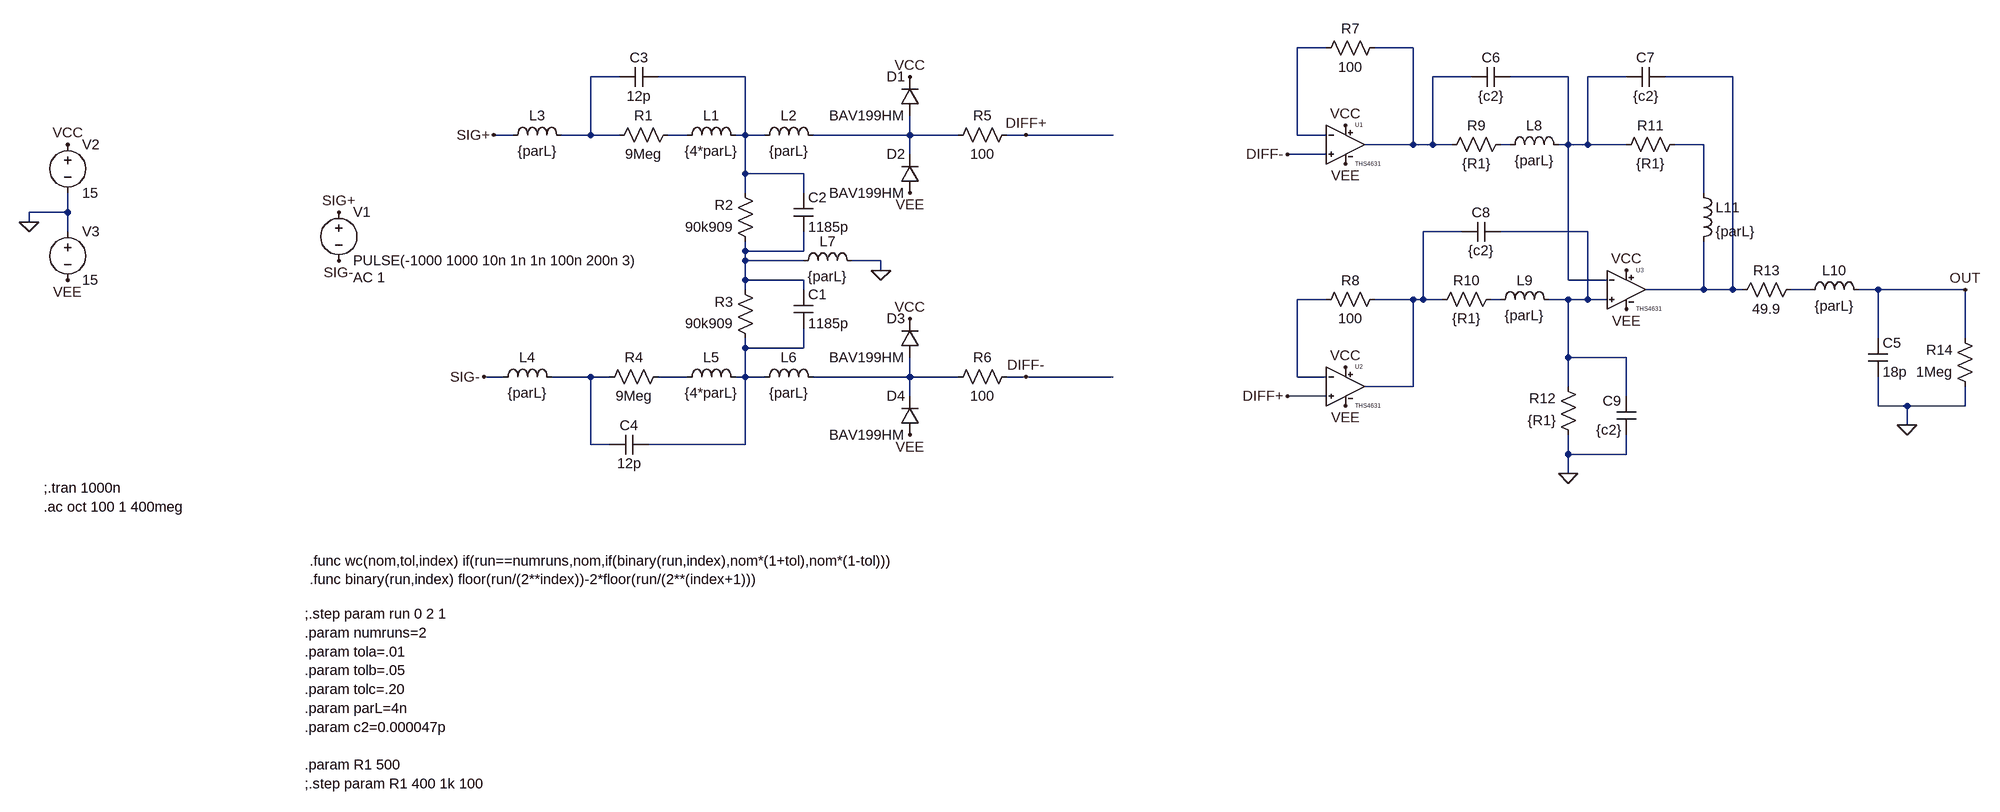
[diagram p0: schematic differential_probe_2.asc]
differential_probe_2.asc, the LTspice schematic file:
Version 4
SHEET 1 2412 1172
WIRE 1136 -32 1088 -32
WIRE 1280 -32 1216 -32
WIRE -32 16 -80 16
WIRE 176 16 32 16
WIRE 1376 16 1312 16
WIRE 1536 16 1440 16
WIRE 1632 16 1568 16
WIRE 1808 16 1696 16
WIRE -208 112 -240 112
WIRE -80 112 -80 16
WIRE -80 112 -128 112
WIRE -32 112 -80 112
WIRE 80 112 48 112
WIRE 176 112 176 16
WIRE 176 112 160 112
WIRE 208 112 176 112
WIRE 448 112 448 80
WIRE 448 112 288 112
WIRE 528 112 448 112
WIRE 640 112 608 112
WIRE 784 112 640 112
WIRE 1088 112 1088 -32
WIRE 1136 112 1088 112
WIRE 1280 128 1280 -32
WIRE 1280 128 1200 128
WIRE 1312 128 1312 16
WIRE 1312 128 1280 128
WIRE 1344 128 1312 128
WIRE 1440 128 1424 128
WIRE 1536 128 1536 16
WIRE 1536 128 1520 128
WIRE 1568 128 1568 16
WIRE 1568 128 1536 128
WIRE 1632 128 1568 128
WIRE 1760 128 1712 128
WIRE 448 144 448 112
WIRE 1136 144 1072 144
WIRE 176 176 176 112
WIRE 272 176 176 176
WIRE 176 208 176 176
WIRE 272 208 272 176
WIRE 1760 208 1760 128
WIRE -944 240 -944 208
WIRE -944 240 -1008 240
WIRE -1008 256 -1008 240
WIRE -944 272 -944 240
WIRE 1360 272 1296 272
WIRE 1568 272 1424 272
WIRE 176 304 176 288
WIRE 272 304 272 272
WIRE 272 304 176 304
WIRE 176 320 176 304
WIRE 272 320 176 320
WIRE 400 320 352 320
WIRE 400 336 400 320
WIRE 176 352 176 320
WIRE 272 352 176 352
WIRE 1536 352 1536 128
WIRE 1600 352 1536 352
WIRE 176 368 176 352
WIRE 272 368 272 352
WIRE 1760 368 1760 288
WIRE 1760 368 1664 368
WIRE 1808 368 1808 16
WIRE 1808 368 1760 368
WIRE 1824 368 1808 368
WIRE 1936 368 1904 368
WIRE 2048 368 2016 368
WIRE 2192 368 2048 368
WIRE 1136 384 1088 384
WIRE 1280 384 1216 384
WIRE 1296 384 1296 272
WIRE 1296 384 1280 384
WIRE 1328 384 1296 384
WIRE 1424 384 1408 384
WIRE 1536 384 1504 384
WIRE 1568 384 1568 272
WIRE 1568 384 1536 384
WIRE 1600 384 1568 384
WIRE 2048 448 2048 368
WIRE 2192 448 2192 368
WIRE 176 464 176 448
WIRE 272 464 272 432
WIRE 272 464 176 464
WIRE 1536 480 1536 384
WIRE 1632 480 1536 480
WIRE -224 512 -256 512
WIRE -80 512 -144 512
WIRE -48 512 -80 512
WIRE 80 512 32 512
WIRE 176 512 176 464
WIRE 176 512 160 512
WIRE 208 512 176 512
WIRE 448 512 448 480
WIRE 448 512 288 512
WIRE 528 512 448 512
WIRE 640 512 608 512
WIRE 784 512 640 512
WIRE 1088 512 1088 384
WIRE 1136 512 1088 512
WIRE 1280 528 1280 384
WIRE 1280 528 1200 528
WIRE 1536 528 1536 480
WIRE 448 544 448 512
WIRE 1136 544 1072 544
WIRE 1632 544 1632 480
WIRE 2048 560 2048 512
WIRE 2096 560 2048 560
WIRE 2192 560 2192 528
WIRE 2192 560 2096 560
WIRE 2096 592 2096 560
WIRE -80 624 -80 512
WIRE -48 624 -80 624
WIRE 176 624 176 512
WIRE 176 624 16 624
WIRE 1536 640 1536 608
WIRE 1632 640 1632 608
WIRE 1632 640 1536 640
WIRE 1536 672 1536 640
FLAG 400 336 0
FLAG -240 112 SIG+
FLAG -256 512 SIG-
FLAG 640 112 DIFF+
FLAG 640 512 DIFF-
FLAG -496 240 SIG+
FLAG -496 320 SIG-
FLAG -1008 256 0
FLAG -944 128 VCC
FLAG -944 352 VEE
FLAG 1168 96 VCC
FLAG 1168 496 VCC
FLAG 1168 160 VEE
FLAG 1168 560 VEE
FLAG 1632 400 VEE
FLAG 1632 336 VCC
FLAG 1536 672 0
FLAG 2096 592 0
FLAG 2192 368 OUT
FLAG 448 208 VEE
FLAG 448 16 VCC
FLAG 448 608 VEE
FLAG 448 416 VCC
FLAG 1072 544 DIFF+
FLAG 1072 144 DIFF-
SYMBOL res 64 96 R90
WINDOW 0 0 56 VBottom 2
WINDOW 3 32 56 VTop 2
SYMATTR InstName R1
SYMATTR Value 9Meg
SYMBOL res 192 304 R180
WINDOW 0 36 76 Left 2
WINDOW 3 36 40 Left 2
SYMATTR InstName R2
SYMATTR Value 90k909
SYMBOL res 192 464 R180
WINDOW 0 36 76 Left 2
WINDOW 3 36 40 Left 2
SYMATTR InstName R3
SYMATTR Value 90k909
SYMBOL res -64 528 R270
WINDOW 0 32 56 VTop 2
WINDOW 3 0 56 VBottom 2
SYMATTR InstName R4
SYMATTR Value 9Meg
SYMBOL cap 256 368 R0
SYMATTR InstName C1
SYMATTR Value 1185p
SYMBOL cap 256 208 R0
SYMATTR InstName C2
SYMATTR Value 1185p
SYMBOL cap 32 0 R90
WINDOW 0 0 32 VBottom 2
WINDOW 3 32 32 VTop 2
SYMATTR InstName C3
SYMATTR Value 12p
SYMBOL cap 16 608 R90
WINDOW 0 0 32 VBottom 2
WINDOW 3 32 32 VTop 2
SYMATTR InstName C4
SYMATTR Value 12p
SYMBOL res 624 96 R90
WINDOW 0 0 56 VBottom 2
WINDOW 3 32 56 VTop 2
SYMATTR InstName R5
SYMATTR Value 100
SYMBOL res 624 496 R90
WINDOW 0 0 56 VBottom 2
WINDOW 3 32 56 VTop 2
SYMATTR InstName R6
SYMATTR Value 100
SYMBOL voltage -496 224 R0
WINDOW 123 24 124 Left 2
WINDOW 39 0 0 Left 0
SYMATTR Value2 AC 1
SYMATTR InstName V1
SYMATTR Value PULSE(-1000 1000 10n 1n 1n 100n 200n 3)
SYMBOL THS4631 1168 64 R0
SYMATTR InstName U1
SYMBOL THS4631 1168 464 R0
SYMATTR InstName U2
SYMBOL THS4631 1632 304 R0
SYMATTR InstName U3
SYMBOL voltage -944 112 R0
WINDOW 123 0 0 Left 0
WINDOW 39 0 0 Left 0
SYMATTR InstName V2
SYMATTR Value 15
SYMBOL voltage -944 256 R0
WINDOW 123 0 0 Left 0
WINDOW 39 0 0 Left 0
SYMATTR InstName V3
SYMATTR Value 15
SYMBOL res 1232 -48 R90
WINDOW 0 0 56 VBottom 2
WINDOW 3 32 56 VTop 2
SYMATTR InstName R7
SYMATTR Value 100
SYMBOL res 1232 368 R90
WINDOW 0 0 56 VBottom 2
WINDOW 3 32 56 VTop 2
SYMATTR InstName R8
SYMATTR Value 100
SYMBOL res 1440 112 R90
WINDOW 0 0 56 VBottom 2
WINDOW 3 32 56 VTop 2
SYMATTR InstName R9
SYMATTR Value {R1}
SYMBOL res 1424 368 R90
WINDOW 0 0 56 VBottom 2
WINDOW 3 32 56 VTop 2
SYMATTR InstName R10
SYMATTR Value {R1}
SYMBOL res 1728 112 R90
WINDOW 0 0 56 VBottom 2
WINDOW 3 32 56 VTop 2
SYMATTR InstName R11
SYMATTR Value {R1}
SYMBOL res 1552 624 R180
WINDOW 0 36 76 Left 2
WINDOW 3 36 40 Left 2
SYMATTR InstName R12
SYMATTR Value {R1}
SYMBOL res 1920 352 R90
WINDOW 0 0 56 VBottom 2
WINDOW 3 32 56 VTop 2
SYMATTR InstName R13
SYMATTR Value 49.9
SYMBOL res 2208 544 R180
WINDOW 0 36 76 Left 2
WINDOW 3 36 40 Left 2
SYMATTR InstName R14
SYMATTR Value 1Meg
SYMBOL cap 2032 448 R0
SYMATTR InstName C5
SYMATTR Value 18p
SYMBOL diode 464 80 R180
WINDOW 0 24 64 Left 2
WINDOW 3 24 0 Left 2
SYMATTR InstName D1
SYMATTR Value BAV199HM
SYMBOL diode 464 208 R180
WINDOW 0 24 64 Left 2
WINDOW 3 24 0 Left 2
SYMATTR InstName D2
SYMATTR Value BAV199HM
SYMBOL diode 464 480 R180
WINDOW 0 24 64 Left 2
WINDOW 3 24 0 Left 2
SYMATTR InstName D3
SYMATTR Value BAV199HM
SYMBOL diode 464 608 R180
WINDOW 0 24 64 Left 2
WINDOW 3 24 0 Left 2
SYMATTR InstName D4
SYMATTR Value BAV199HM
SYMBOL ind 64 128 R270
WINDOW 0 32 56 VTop 2
WINDOW 3 5 56 VBottom 2
SYMATTR InstName L1
SYMATTR Value {4*parL}
SYMBOL ind 192 128 R270
WINDOW 0 32 56 VTop 2
WINDOW 3 5 56 VBottom 2
SYMATTR InstName L2
SYMATTR Value {parL}
SYMBOL ind -224 128 R270
WINDOW 0 32 56 VTop 2
WINDOW 3 5 56 VBottom 2
SYMATTR InstName L3
SYMATTR Value {parL}
SYMBOL ind -240 528 R270
WINDOW 0 32 56 VTop 2
WINDOW 3 5 56 VBottom 2
SYMATTR InstName L4
SYMATTR Value {parL}
SYMBOL ind 64 528 R270
WINDOW 0 32 56 VTop 2
WINDOW 3 5 56 VBottom 2
SYMATTR InstName L5
SYMATTR Value {4*parL}
SYMBOL ind 192 528 R270
WINDOW 0 32 56 VTop 2
WINDOW 3 5 56 VBottom 2
SYMATTR InstName L6
SYMATTR Value {parL}
SYMBOL ind 256 336 R270
WINDOW 0 32 56 VTop 2
WINDOW 3 5 56 VBottom 2
SYMATTR InstName L7
SYMATTR Value {parL}
SYMBOL ind 1424 144 R270
WINDOW 0 32 56 VTop 2
WINDOW 3 5 56 VBottom 2
SYMATTR InstName L8
SYMATTR Value {parL}
SYMBOL ind 1408 400 R270
WINDOW 0 32 56 VTop 2
WINDOW 3 5 56 VBottom 2
SYMATTR InstName L9
SYMATTR Value {parL}
SYMBOL ind 1920 384 R270
WINDOW 0 32 56 VTop 2
WINDOW 3 5 56 VBottom 2
SYMATTR InstName L10
SYMATTR Value {parL}
SYMBOL ind 1744 192 R0
SYMATTR InstName L11
SYMATTR Value {parL}
SYMBOL cap 1440 0 R90
WINDOW 0 0 32 VBottom 2
WINDOW 3 32 32 VTop 2
SYMATTR InstName C6
SYMATTR Value {c2}
SYMBOL cap 1696 0 R90
WINDOW 0 0 32 VBottom 2
WINDOW 3 32 32 VTop 2
SYMATTR InstName C7
SYMATTR Value {c2}
SYMBOL cap 1424 256 R90
WINDOW 0 0 32 VBottom 2
WINDOW 3 32 32 VTop 2
SYMATTR InstName C8
SYMATTR Value {c2}
SYMBOL cap 1648 608 R180
WINDOW 0 24 56 Left 2
WINDOW 3 24 8 Left 2
SYMATTR InstName C9
SYMATTR Value {c2}
TEXT -984 696 Left 2 !;.tran 1000n\n.ac oct 100 1 400meg
TEXT -544 816 Left 2 !.func wc(nom,tol,index) if(run==numruns,nom,if(binary(run,index),nom*(1+tol),nom*(1-tol)))\n.func binary(run,index) floor(run/(2**index))-2*floor(run/(2**(index+1)))
TEXT -552 904 Left 2 !;.step param run 0 2 1\n.param numruns=2\n.param tola=.01\n.param tolb=.05\n.param tolc=.20\n.param parL=4n\n.param c2=0.000047p\n \n.param R1 500\n;.step param R1 400 1k 100

The netlist it stands for:
* differential_probe_2.asc
R1 N007 N003 9Meg
R2 N013 N004 90k909
R3 N017 N013 90k909
R4 N018 N019 9Meg
C1 N013 N017 1185p
C2 N004 N013 1185p
C3 N004 N003 12p
C4 N017 N018 12p
R5 DIFF+ N008 100
R6 DIFF- N020 100
V1 SIG+ SIG- PULSE(-1000 1000 10n 1n 1n 100n 200n 3) AC 1
XU1 DIFF- N001 VCC VEE N002 THS4631  ; pins IN+ IN- VCC VEE OUT
XU2 DIFF+ N015 VCC VEE N011 THS4631  ; pins IN+ IN- VCC VEE OUT
XU3 N012 N005 VCC VEE N006 THS4631  ; pins IN+ IN- VCC VEE OUT
V2 VCC 0 15
V3 0 VEE 15
R7 N002 N001 100
R8 N011 N015 100
R9 N009 N002 {R1}
R10 N016 N011 {R1}
R11 N010 N005 {R1}
R12 0 N012 {R1}
R13 N014 N006 49.9
R14 0 OUT 1Meg
C5 OUT 0 18p
D1 N008 VCC BAV199HM
D2 VEE N008 BAV199HM
D3 N020 VCC BAV199HM
D4 VEE N020 BAV199HM
L1 N007 N004 {4*parL}
L2 N004 N008 {parL}
L3 SIG+ N003 {parL}
L4 SIG- N018 {parL}
L5 N019 N017 {4*parL}
L6 N017 N020 {parL}
L7 N013 0 {parL}
L8 N009 N005 {parL}
L9 N016 N012 {parL}
L10 N014 OUT {parL}
L11 N010 N006 {parL}
C6 N005 N002 {c2}
C7 N006 N005 {c2}
C8 N012 N011 {c2}
C9 0 N012 {c2}
.model D D
.lib standard.dio
;.tran 1000n
.ac oct 100 1 400meg
.func wc(nom,tol,index) if(run==numruns,nom,if(binary(run,index),nom*(1+tol),nom*(1-tol)))
.func binary(run,index) floor(run/(2**index))-2*floor(run/(2**(index+1)))
;.step param run 0 2 1
.param numruns=2
.param tola=.01
.param tolb=.05
.param tolc=.20
.param parL=4n
.param c2=0.000047p
.param R1 500
;.step param R1 400 1k 100
.lib THS4631.lib
.backanno
.end